# Altium project DATALOGER_final.PrjPcb (part 2 of 2)
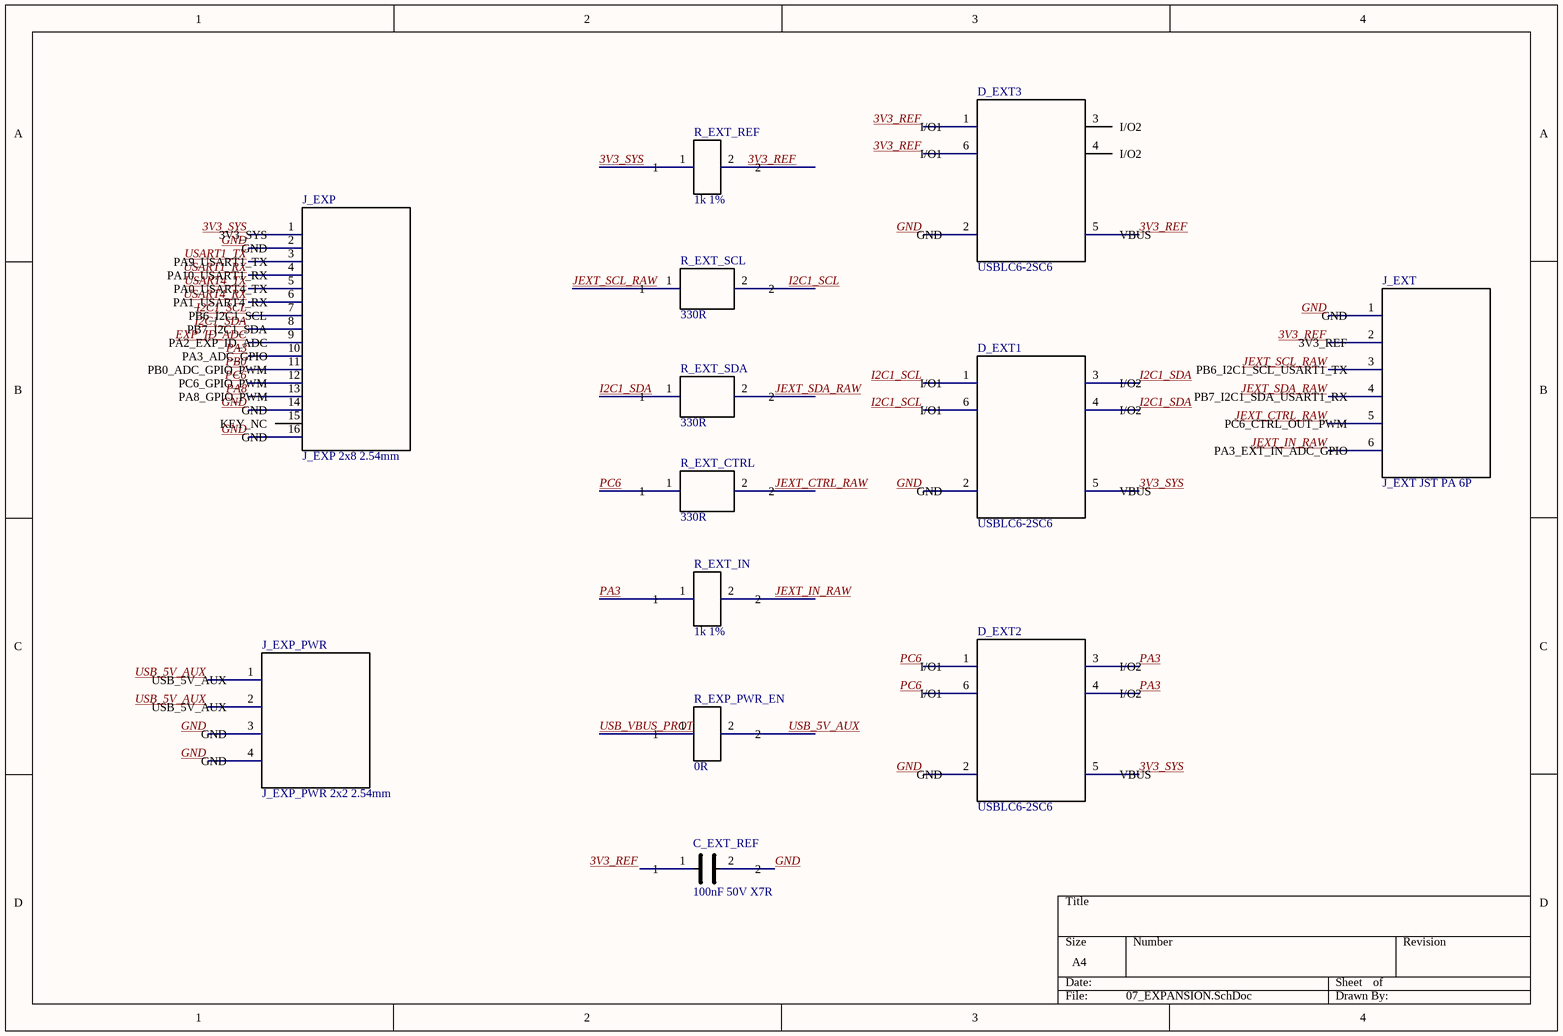
[diagram p7: 07_EXPANSION.SchDoc]

## Nets that join several sheets
GND: 01_POWER (19 pins), 02_MCU_CORE (7 pins), 03_MICROSD (14 pins), 04_NAVIGATION (10 pins), 05_RTC (11 pins), 06_OLED_SHT3X (17 pins), 07_EXPANSION (10 pins)
3V3_SYS: 01_POWER (5 pins), 02_MCU_CORE (C_MCU_BULK.2 C_MCU_HF.2 J_SWD.1 U_MCU.4), 03_MICROSD (6 pins), 04_NAVIGATION (R_PULL1.2 R_PULL2.2 R_PULL3.2 R_PULL4.2), 05_RTC (C_RTC.1 R_RTC_INT_PU.1 U_RTC.2), 06_OLED_SHT3X (8 pins), 07_EXPANSION (D_EXT1.5 D_EXT2.5 J_EXP.1 R_EXT_REF.1)
EXP_ID_ADC: 02_MCU_CORE (U_MCU.9), 07_EXPANSION (J_EXP.9)
I2C1_SCL: 02_MCU_CORE (U_MCU.30), 07_EXPANSION (D_EXT1.1 D_EXT1.6 J_EXP.7 R_EXT_SCL.2)
I2C1_SDA: 02_MCU_CORE (U_MCU.31), 07_EXPANSION (D_EXT1.3 D_EXT1.4 J_EXP.8 R_EXT_SDA.1)
I2C2_SCL: 02_MCU_CORE (U_MCU.22), 05_RTC (U_RTC.16), 06_OLED_SHT3X (R_SCL_PU.1 R_SCL_SER.2 U_OLED_SW.1)
I2C2_SDA: 02_MCU_CORE (U_MCU.23), 05_RTC (U_RTC.15), 06_OLED_SHT3X (R_SDA_PU.1 R_SDA_SER.2 U_OLED_SW.3)
KEY_BACK: 02_MCU_CORE (U_MCU.32), 04_NAVIGATION (C_FIL4.1 R_PULL4.1 R_SER4.2)
KEY_DOWN: 02_MCU_CORE (U_MCU.28), 04_NAVIGATION (C_FIL2.1 R_PULL2.1 R_SER2.2)
KEY_SET: 02_MCU_CORE (U_MCU.29), 04_NAVIGATION (C_FIL3.1 R_PULL3.1 R_SER3.2)
KEY_UP: 02_MCU_CORE (U_MCU.26), 04_NAVIGATION (C_FIL1.1 R_PULL1.1 R_SER1.2)
OLED_CTL: 02_MCU_CORE (U_MCU.17), 06_OLED_SHT3X (D_DELAY.1 R_DELAY.1 R_OLED_BASE.1)
PA3: 02_MCU_CORE (U_MCU.10), 07_EXPANSION (D_EXT2.3 D_EXT2.4 J_EXP.10 R_EXT_IN.1)
PA8: 02_MCU_CORE (U_MCU.18), 07_EXPANSION (J_EXP.13)
PB0: 02_MCU_CORE (U_MCU.15), 07_EXPANSION (J_EXP.11)
PC6: 02_MCU_CORE (U_MCU.20), 07_EXPANSION (D_EXT2.1 D_EXT2.6 J_EXP.12 R_EXT_CTRL.1)
RTC_INT_N: 02_MCU_CORE (U_MCU.27), 05_RTC (R_RTC_INT_PU.2 TP_RTC_INT.1 U_RTC.3)
SD_CARD_DET_N: 02_MCU_CORE (U_MCU.1), 03_MICROSD (J_SD.9 R_CD_PU.2)
SD_CS: 02_MCU_CORE (U_MCU.11), 03_MICROSD (U_SD_BUF.2)
SD_MISO: 02_MCU_CORE (U_MCU.13), 03_MICROSD (R_MISO.2 R_MISO_PD.1)
SD_MOSI: 02_MCU_CORE (U_MCU.14), 03_MICROSD (U_SD_BUF.9)
SD_PWR_CTL: 02_MCU_CORE (U_MCU.16), 03_MICROSD (R_SD_DRV_BASE.2)
SD_SCK: 02_MCU_CORE (U_MCU.12), 03_MICROSD (U_SD_BUF.5)
USART1_RX: 02_MCU_CORE (U_MCU.21), 07_EXPANSION (J_EXP.4)
USART1_TX: 02_MCU_CORE (U_MCU.19), 07_EXPANSION (J_EXP.3)
USART4_RX: 02_MCU_CORE (U_MCU.8), 07_EXPANSION (J_EXP.6)
USART4_TX: 02_MCU_CORE (U_MCU.7), 07_EXPANSION (J_EXP.5)
USB_VBUS_PROT: 01_POWER (7 pins), 07_EXPANSION (R_EXP_PWR_EN.1)